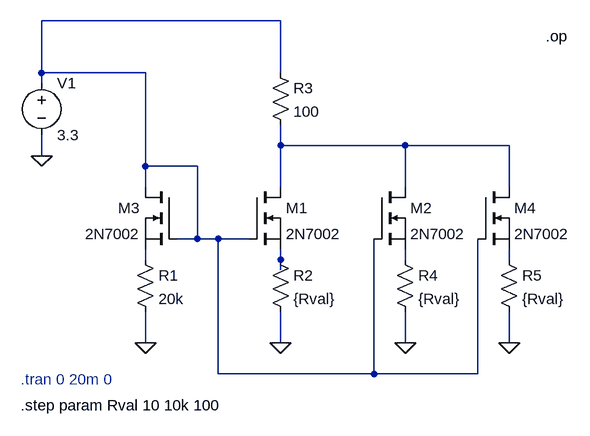
[diagram p0: schematic Espejo_Alex.asc]
Espejo_Alex.asc, the LTspice schematic file:
Version 4
SHEET 1 880 848
WIRE -256 32 -624 32
WIRE -624 112 -624 32
WIRE -464 112 -624 112
WIRE -256 112 -256 32
WIRE -624 128 -624 112
WIRE -256 224 -256 192
WIRE -64 224 -256 224
WIRE 96 224 -64 224
WIRE -624 240 -624 208
WIRE -464 256 -464 112
WIRE -384 256 -464 256
WIRE -464 288 -464 256
WIRE -256 288 -256 224
WIRE -64 288 -64 224
WIRE 96 288 96 224
WIRE -384 368 -384 256
WIRE -384 368 -416 368
WIRE -352 368 -384 368
WIRE -304 368 -352 368
WIRE -464 400 -464 384
WIRE -256 400 -256 384
WIRE -64 400 -64 384
WIRE 96 400 96 384
WIRE -256 416 -256 400
WIRE -464 528 -464 480
WIRE -256 528 -256 480
WIRE -64 528 -64 480
WIRE 96 528 96 480
WIRE -352 576 -352 368
WIRE -112 576 -112 368
WIRE -112 576 -352 576
WIRE 48 576 48 368
WIRE 48 576 -112 576
FLAG -464 528 0
FLAG -256 528 0
FLAG -64 528 0
FLAG -624 240 0
FLAG 96 528 0
DATAFLAG -112 224 ""
DATAFLAG -384 288 ""
DATAFLAG -256 416 ""
DATAFLAG -112 96 "I(R3)"
SYMBOL res -480 384 R0
SYMATTR InstName R1
SYMATTR Value 20k
SYMBOL res -272 384 R0
SYMATTR InstName R2
SYMATTR Value {Rval}
SYMBOL res -272 96 R0
SYMATTR InstName R3
SYMATTR Value 100
SYMBOL res -80 384 R0
SYMATTR InstName R4
SYMATTR Value {Rval}
SYMBOL voltage -624 112 R0
WINDOW 123 0 0 Left 0
WINDOW 39 0 0 Left 0
SYMATTR InstName V1
SYMATTR Value 3.3
SYMBOL nmos -416 288 M0
SYMATTR InstName M3
SYMATTR Value 2N7002
SYMBOL nmos -304 288 R0
SYMATTR InstName M1
SYMATTR Value 2N7002
SYMBOL nmos -112 288 R0
SYMATTR InstName M2
SYMATTR Value 2N7002
SYMBOL nmos 48 288 R0
SYMATTR InstName M4
SYMATTR Value 2N7002
SYMBOL res 80 384 R0
SYMATTR InstName R5
SYMATTR Value {Rval}
TEXT -656 584 Left 2 ;.tran 0 20m 0
TEXT 152 56 Left 2 !.op
TEXT -656 624 Left 2 !.step param Rval 10 10k 100

The netlist it stands for:
* Espejo_Alex.asc
R1 N003 0 20k
R2 N004 0 {Rval}
R3 N001 N002 100
R4 N005 0 {Rval}
V1 N001 0 3.3
M3 N001 N001 N003 N003 2N7002
M1 N002 N001 N004 N004 2N7002
M2 N002 N001 N005 N005 2N7002
M4 N002 N001 N006 N006 2N7002
R5 N006 0 {Rval}
.model NMOS NMOS
.model PMOS PMOS
.lib standard.mos
* .tran 0 20m 0
.op
.step param Rval 10 10k 100
.backanno
.end

* Results of the author's LTspice run, read from the files saved beside the schematic
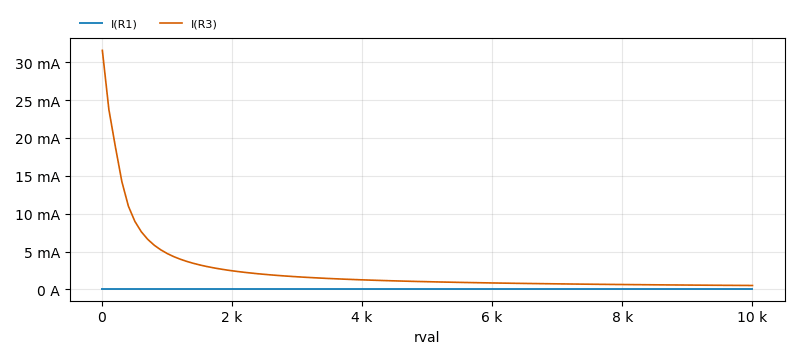
[diagram p1: Operating Point of Espejo_Alex.asc, plotted from the saved traces]
* Operating Point, 1 run:
*   I(R1): 89.78 µA at rval=10 , 89.78 µA at rval=10 k, min 89.78 µA, max 89.78 µA
*   I(R3): 31.55 mA at rval=10 , 526.5 µA at rval=10 k, min 526.5 µA, max 31.55 mA
* From the log:
*   Semiconductor Device Operating Points:
*                           --- VDMOSFET Transistors ---
*   Name:          m3          m1          m2          m4
*   Model:       2n7002      2n7002      2n7002      2n7002
*   Id:          8.98e-05    1.05e-02    1.05e-02    1.05e-02
*   Vgs:         1.50e+00    3.19e+00    3.19e+00    3.19e+00
*   Vds:         1.50e+00    3.95e-02    3.95e-02    3.95e-02
*   Vth:         1.60e+00    1.60e+00    1.60e+00    1.60e+00
*   Gm:          1.53e-03    6.71e-03    6.71e-03    6.71e-03
*   Gds:         0.00e+00    3.29e-01    3.29e-01    3.29e-01
*   Cgs:         5.00e-11    5.00e-11    5.00e-11    5.00e-11
*   Cgd:         5.35e-11    7.99e-11    7.99e-11    7.99e-11
*   Cbody:       3.16e-11    4.90e-11    4.90e-11    4.90e-11